# Altium schematic sheet S bus (5.775 X 3.30 inches).schdoc: Módulo do processamento do Kit didático
size A4; Organization: PEA USP; Address1: Address1; Address2: Address2; Address3: Address3; Address4: Address4; DocumentNumber: 1; Revision: LMK, HMH; SheetNumber: 1; SheetTotal: 1; Author: Gustavo Soares Valentim; ProjectName: Módulo do processamento
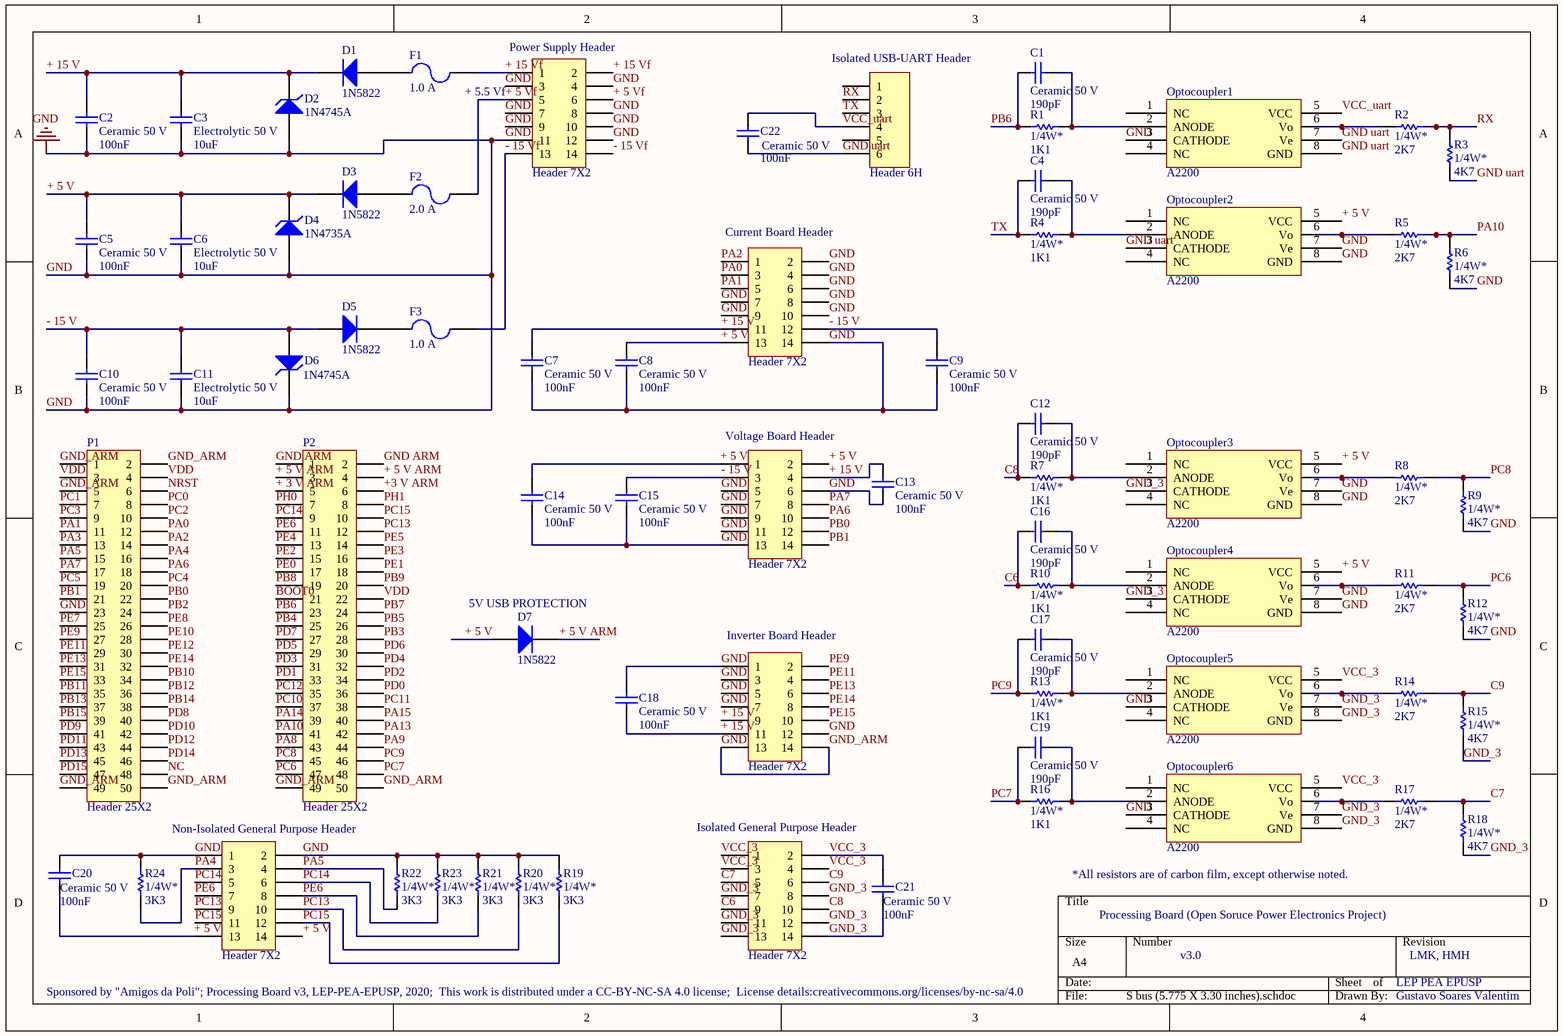
[diagram p0: S bus (5.775 X 3.30 inches).schdoc]

## Parts
C1  Ceramic 50 V  value 190pF  [RAD-0.2]
C2  Ceramic 50 V  value 100nF  [RAD-0.2]
C3  Electrolytic 50 V  value 10uF  [RB5-10.5]
C4  Ceramic 50 V  value 190pF  [RAD-0.2]
C5  Ceramic 50 V  value 100nF  [RAD-0.2]
C6  Electrolytic 50 V  value 10uF  [RB5-10.5]
C7  Ceramic 50 V  value 100nF  [RAD-0.2]
C8  Ceramic 50 V  value 100nF  [RAD-0.2]
C9  Ceramic 50 V  value 100nF  [RAD-0.2]
C10  Ceramic 50 V  value 100nF  [RAD-0.2]
C11  Electrolytic 50 V  value 10uF  [RB5-10.5]
C12  Ceramic 50 V  value 190pF  [RAD-0.2]
C13  Ceramic 50 V  value 100nF  [RAD-0.2]
C14  Ceramic 50 V  value 100nF  [RAD-0.2]
C15  Ceramic 50 V  value 100nF  [RAD-0.2]
C16  Ceramic 50 V  value 190pF  [RAD-0.2]
C17  Ceramic 50 V  value 190pF  [RAD-0.2]
C18  Ceramic 50 V  value 100nF  [RAD-0.2]
C19  Ceramic 50 V  value 190pF  [RAD-0.2]
C20  Ceramic 50 V  value 100nF  [RAD-0.2]
C21  Ceramic 50 V  value 100nF  [RAD-0.2]
C22  Ceramic 50 V  value 100nF  [RAD-0.2]
Current_Board_Header  Header 7X2  [HDR2X7]
D1  1N5822  [AXIAL-0.4]
D2  1N4745A  [DIODE-0.4]
D3  1N5822  [AXIAL-0.4]
D4  1N4735A  [DIODE-0.4]
D5  1N5822  [AXIAL-0.4]
D6  1N4745A  [DIODE-0.4]
D7  1N5822  [AXIAL-0.4]
F1  1.0 A  [Fusivel]
F2  2.0 A  [Fusivel]
F3  1.0 A  [Fusivel]
Inverter_Board_Header  Header 7X2  [HDR2X7]
Isolated_General_Purpose_Header  Header 7X2  [HDR2X7]
Isolated_USB-UART_Header  Header 6H  [HDR1X6]
Non-Isolated_General_Purpose_Header  Header 7X2  [HDR2X7]
Optocoupler1  A2200  [DIP8]
Optocoupler2  A2200  [DIP8]
Optocoupler3  A2200  [DIP8]
Optocoupler4  A2200  [DIP8]
Optocoupler5  A2200  [DIP8]
Optocoupler6  A2200  [DIP8]
P1  Header 25X2  [HDR2X25]
P2  Header 25X2  [HDR2X25]
Power_Supply_Header  Header 7X2  [HDR2X7]
R1  1/4W*  value 1K1  [AXIAL-0.3]
R2  1/4W*  value 2K7  [AXIAL-0.3]
R3  1/4W*  value 4K7  [AXIAL-0.3]
R4  1/4W*  value 1K1  [AXIAL-0.3]
R5  1/4W*  value 2K7  [AXIAL-0.3]
R6  1/4W*  value 4K7  [AXIAL-0.3]
R7  1/4W*  value 1K1  [AXIAL-0.3]
R8  1/4W*  value 2K7  [AXIAL-0.3]
R9  1/4W*  value 4K7  [AXIAL-0.3]
R10  1/4W*  value 1K1  [AXIAL-0.3]
R11  1/4W*  value 2K7  [AXIAL-0.3]
R12  1/4W*  value 4K7  [AXIAL-0.3]
R13  1/4W*  value 1K1  [AXIAL-0.3]
R14  1/4W*  value 2K7  [AXIAL-0.3]
R15  1/4W*  value 4K7  [AXIAL-0.3]
R16  1/4W*  value 1K1  [AXIAL-0.3]
R17  1/4W*  value 2K7  [AXIAL-0.3]
R18  1/4W*  value 4K7  [AXIAL-0.3]
R19  1/4W*  value 3K3  [AXIAL-0.3]
R20  1/4W*  value 3K3  [AXIAL-0.3]
R21  1/4W*  value 3K3  [AXIAL-0.3]
R22  1/4W*  value 3K3  [AXIAL-0.3]
R23  1/4W*  value 3K3  [AXIAL-0.3]
R24  1/4W*  value 3K3  [AXIAL-0.3]
Voltage_Board_Header  Header 7X2  [HDR2X7]

## Nets
GND: C2.1 C3.1 C5.1 C6.1 C7.1 C8.1 C9.1 C10.1 C11.1 C13.1 C14.1 C15.1 C18.2 C20.2 Current_Board_Header.2 Current_Board_Header.4 Current_Board_Header.6 Current_Board_Header.7 Current_Board_Header.8 Current_Board_Header.9 Current_Board_Header.10 Current_Board_Header.14 D2.1(A) D4.1(A) D6.2(K) Inverter_Board_Header.1 Inverter_Board_Header.3 Inverter_Board_Header.5 Inverter_Board_Header.7 Inverter_Board_Header.12 Inverter_Board_Header.13 Inverter_Board_Header.14 Non-Isolated_General_Purpose_Header.1 Non-Isolated_General_Purpose_Header.2 Optocoupler1.3(CATHODE) Optocoupler2.7(Ve) Optocoupler2.8(GND) Optocoupler3.7(Ve) Optocoupler3.8(GND) Optocoupler4.7(Ve) Optocoupler4.8(GND) Optocoupler5.3(CATHODE) Optocoupler6.3(CATHODE) P1.1 P1.2 P1.5 P1.23 P1.49 P1.50 P2.49 P2.50 Power_Supply_Header.3 Power_Supply_Header.4 Power_Supply_Header.7 Power_Supply_Header.8 Power_Supply_Header.9 Power_Supply_Header.10 Power_Supply_Header.11 Power_Supply_Header.12 R6.1 R9.1 R12.1 R19.2 R20.2 R21.2 R22.2 R23.2 R24.2 Voltage_Board_Header.5 Voltage_Board_Header.6 Voltage_Board_Header.7 Voltage_Board_Header.9 Voltage_Board_Header.11 Voltage_Board_Header.13  [also labelled GND_ARM]
+3 V ARM: P2.6
+ 3 V ARM: P2.5
+ 5 V: C5.2 C6.2 C8.2 C14.2 C20.1 Current_Board_Header.13 D3.2(K) D4.2(K) D7.1(A) Non-Isolated_General_Purpose_Header.13 Non-Isolated_General_Purpose_Header.14 Optocoupler2.5(VCC) Optocoupler3.5(VCC) Optocoupler4.5(VCC) Voltage_Board_Header.1 Voltage_Board_Header.2
+ 5 V ARM: D7.2(K) P2.3 P2.4
+ 5 Vf: F2.2 Power_Supply_Header.5 Power_Supply_Header.6
+ 15 V: C2.2 C3.2 C7.2 C13.2 C18.1 Current_Board_Header.11 D1.2(K) D2.2(K) Inverter_Board_Header.9 Inverter_Board_Header.11 Voltage_Board_Header.4
+ 15 Vf: F1.2 Power_Supply_Header.1 Power_Supply_Header.2
- 15 V: C9.2 C10.2 C11.2 C15.2 Current_Board_Header.12 D5.1(A) D6.1(A) Voltage_Board_Header.3
- 15 Vf: F3.2 Power_Supply_Header.13 Power_Supply_Header.14
BOOT0: P2.21
C6: C16.2 Isolated_General_Purpose_Header.9 R10.1
C7: Isolated_General_Purpose_Header.5 R17.2 R18.2
C8: C12.2 Isolated_General_Purpose_Header.10 R7.1
C9: Isolated_General_Purpose_Header.6 R14.2 R15.2
GND ARM: P2.1 P2.2
GND uart: C22.1 Isolated_USB-UART_Header.6 Optocoupler1.7(Ve) Optocoupler1.8(GND) Optocoupler2.3(CATHODE) R3.1
GND_3: C21.1 Isolated_General_Purpose_Header.7 Isolated_General_Purpose_Header.8 Isolated_General_Purpose_Header.11 Isolated_General_Purpose_Header.12 Isolated_General_Purpose_Header.13 Isolated_General_Purpose_Header.14 Optocoupler3.3(CATHODE) Optocoupler4.3(CATHODE) Optocoupler5.7(Ve) Optocoupler5.8(GND) Optocoupler6.7(Ve) Optocoupler6.8(GND) R15.1 R18.1
NC: P1.48
NRST: P1.6
PA0: Current_Board_Header.3 P1.12
PA1: Current_Board_Header.5 P1.11
PA2: Current_Board_Header.1 P1.14
PA3: P1.13
PA4: Non-Isolated_General_Purpose_Header.3 P1.16 R24.1
PA5: Non-Isolated_General_Purpose_Header.4 P1.15 R22.1
PA6: P1.18 Voltage_Board_Header.10
PA7: P1.17 Voltage_Board_Header.8
PA8: P2.43
PA9: P2.44
PA10: P2.41 R5.2 R6.2
PA13: P2.42
PA14: P2.39
PA15: P2.40
PB0: P1.22 Voltage_Board_Header.12
PB1: P1.21 Voltage_Board_Header.14
PB2: P1.24
PB3: P2.28
PB4: P2.25
PB5: P2.26
PB6: C1.2 P2.23 R1.1
PB7: P2.24
PB8: P2.19
PB9: P2.20
PB10: P1.34
PB11: P1.35
PB12: P1.36
PB13: P1.37
PB14: P1.38
PB15: P1.39
PC0: P1.8
PC1: P1.7
PC2: P1.10
PC3: P1.9
PC4: P1.20
PC5: P1.19
PC6: P2.47 R11.2 R12.2
PC7: C19.2 P2.48 R16.1
PC8: P2.45 R8.2 R9.2
PC9: C17.2 P2.46 R13.1
PC10: P2.37
PC11: P2.38
PC12: P2.35
PC13: Non-Isolated_General_Purpose_Header.9 Non-Isolated_General_Purpose_Header.10 P2.12 R20.1
PC14: Non-Isolated_General_Purpose_Header.5 Non-Isolated_General_Purpose_Header.6 P2.9 R23.1
PC15: Non-Isolated_General_Purpose_Header.11 Non-Isolated_General_Purpose_Header.12 P2.10 R19.1
PD0: P2.36
PD1: P2.33
PD2: P2.34
PD3: P2.31
PD4: P2.32
PD5: P2.29
PD6: P2.30
PD7: P2.27
PD8: P1.40
PD9: P1.41
PD10: P1.42
PD11: P1.43
PD12: P1.44
PD13: P1.45
PD14: P1.46
PD15: P1.47
PE0: P2.17
PE1: P2.18
PE2: P2.15
PE3: P2.16
PE4: P2.13
PE5: P2.14
PE6: Non-Isolated_General_Purpose_Header.7 Non-Isolated_General_Purpose_Header.8 P2.11 R21.1
PE7: P1.25
PE8: P1.26
PE9: Inverter_Board_Header.2 P1.27
PE10: P1.28
PE11: Inverter_Board_Header.4 P1.29
PE12: P1.30
PE13: Inverter_Board_Header.6 P1.31
PE14: Inverter_Board_Header.8 P1.32
PE15: Inverter_Board_Header.10 P1.33
PH0: P2.7
PH1: P2.8
RX: Isolated_USB-UART_Header.2 R2.2 R3.2
TX: C4.2 Isolated_USB-UART_Header.3 R4.1
VCC_3: C21.2 Isolated_General_Purpose_Header.1 Isolated_General_Purpose_Header.2 Isolated_General_Purpose_Header.3 Isolated_General_Purpose_Header.4 Optocoupler5.5(VCC) Optocoupler6.5(VCC)
VCC_uart: C22.2 Isolated_USB-UART_Header.4 Optocoupler1.5(VCC)
VDD: P1.3 P1.4 P2.22
NetC1_1: C1.1 Optocoupler1.2(ANODE) R1.2
NetC4_1: C4.1 Optocoupler2.2(ANODE) R4.2
NetC12_1: C12.1 Optocoupler3.2(ANODE) R7.2
NetC16_1: C16.1 Optocoupler4.2(ANODE) R10.2
NetC17_1: C17.1 Optocoupler5.2(ANODE) R13.2
NetC19_1: C19.1 Optocoupler6.2(ANODE) R16.2
NetD1_1: D1.1(A) F1.1
NetD3_1: D3.1(A) F2.1
NetD5_2: D5.2(K) F3.1
NetOptocoupler1_6: Optocoupler1.6(Vo) R2.1
NetOptocoupler2_6: Optocoupler2.6(Vo) R5.1
NetOptocoupler3_6: Optocoupler3.6(Vo) R8.1
NetOptocoupler4_6: Optocoupler4.6(Vo) R11.1
NetOptocoupler5_6: Optocoupler5.6(Vo) R14.1
NetOptocoupler6_6: Optocoupler6.6(Vo) R17.1

Not connected (* = marked no-connect by the designer): Isolated_USB-UART_Header 1 5; Optocoupler1 1(NC) 4(NC); Optocoupler2 1(NC) 4(NC); Optocoupler3 1(NC) 4(NC); Optocoupler4 1(NC) 4(NC); Optocoupler5 1(NC) 4(NC); Optocoupler6 1(NC) 4(NC)

## Notes on the sheet
- + 5.5 Vf
- (near D7) 5V USB PROTECTION
- *All resistors are of carbon film, except otherwise noted.
- Processing Board (Open Soruce Power Electronics Project)
- v3.0
- LEP PEA EPUSP
- Sponsored by "Amigos da Poli"; Processing Board v3, LEP-PEA-EPUSP, 2020;  This work is distributed under a CC-BY-NC-SA 4.0 license;  License details:creativecommons.org/licenses/by-nc-sa/4.0

## Library data of the parts
C1-C22 = Cap: Capacitor; Published: 8-Jun-2000; LatestRevisionDate: 17-Jul-2002; LatestRevisionNote: Re-released for DXP Platform.; PackageReference: RAD-0.3; Publisher: Altium Limited; PackageDescription: Radial Cap, Thru-Hole; 2 Leads; 0.3 in Pin Spacing
Current_Board_Header Inverter_Board_Header Isolated_General_Purpose_Header Non-Isolated_General_Purpose_Header Power_Supply_Header Voltage_Board_Header = Header 7X2: Header, 7-Pin, Dual row; LatestRevisionDate: 17-Jul-2002; LatestRevisionNote: Re-released for DXP Platform.; Publisher: Altium Limited
D1 D3 D5 D7 = Diode: Default Diode; Published: 8-Jun-2000; LatestRevisionDate: 17-Jul-2002; LatestRevisionNote: Re-released for DXP Platform.; PackageVersion: Sep-1996; PackageReference: SMC; Publisher: Altium Limited; PackageDescription: DO-214-AB/SMC; 2 C-Bend Leads; Body 7.9 x 5.9 mm, inc. leads (LxW); Code_JEDEC: DO-214-AB
D2 D4 D6 = D Zener: Zener Diode; Published: 8-Jun-2000; LatestRevisionDate: 17-Jul-2002; LatestRevisionNote: Re-released for DXP Platform.; PackageReference: DIODE-0.7; Publisher: Altium Limited; PackageDescription: Diode, Thru-Hole; 2 Leads; 0.7 in Pin Spacing
F1-F3 = Fuse 2: Fuse; Published: 8-Jun-2000; LatestRevisionDate: 17-Jul-2002; LatestRevisionNote: Re-released for DXP Platform.; PackageReference: PIN-W2/E2.8; Publisher: Altium Limited; PackageDescription: Thru-Hole; 2 Leads
Isolated_USB-UART_Header = Header 6H: Header, 6-Pin, Right Angle; LatestRevisionDate: 17-Jul-2002; LatestRevisionNote: Re-released for DXP Platform.; Publisher: Altium Limited
Optocoupler1-Optocoupler6 = Optoacoplador
P1 P2 = Header 25X2: Header, 25-Pin, Dual row; LatestRevisionDate: 17-Jul-2002; LatestRevisionNote: Re-released for DXP Platform.; Publisher: Altium Limited
R1-R24 = Res1: Resistor; Published: 8-Jun-2000; LatestRevisionDate: 17-Jul-2002; LatestRevisionNote: Re-released for DXP Platform.; PackageReference: AXIAL-0.3; Publisher: Altium Limited; PackageDescription: Axial Device, Thru-Hole; 2 Leads; 0.3 in Pin Spacing